# EasyEDA Pro project travellium-12v-desktop-power-supply-cc8d8467.epro, board EG1163S_C_PCB_1
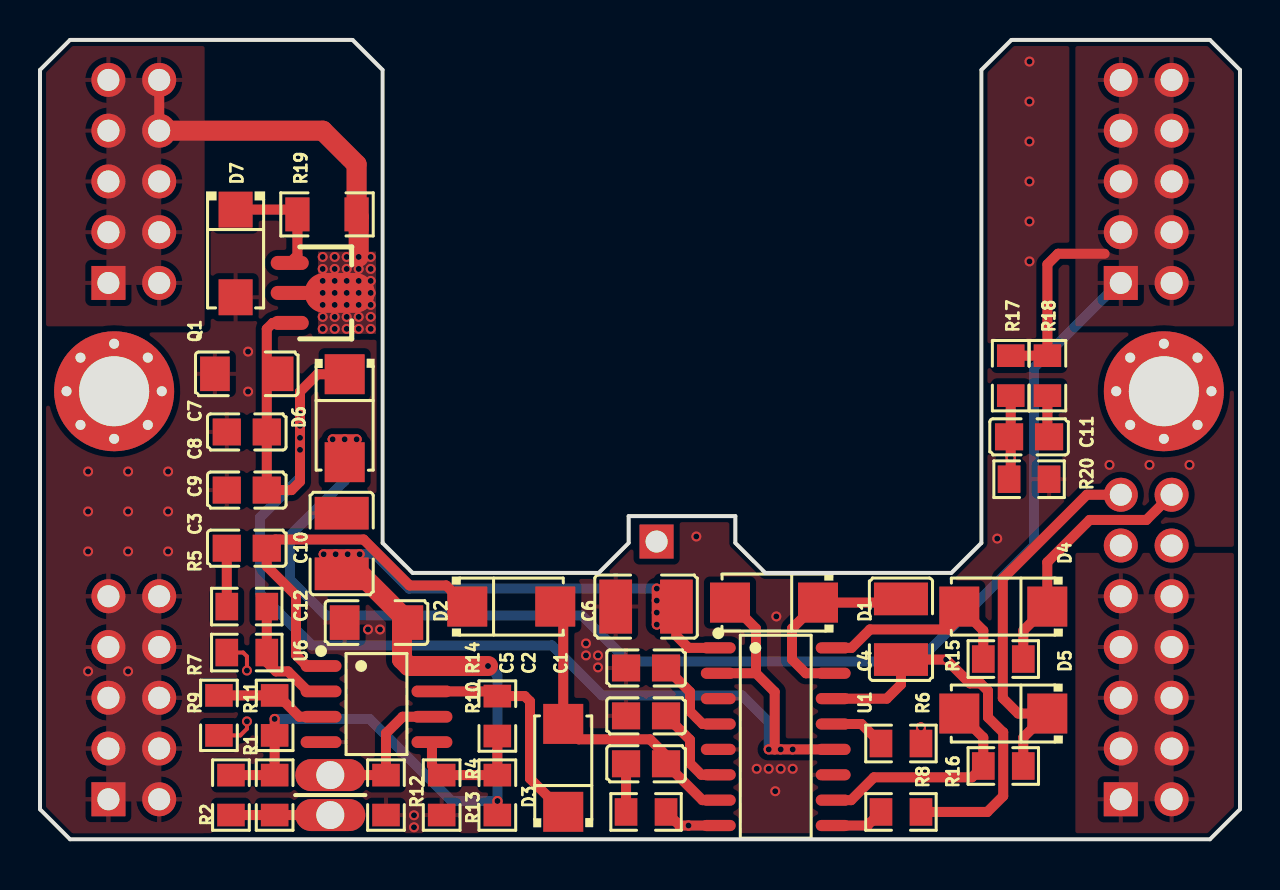
[diagram p15: board, top side]
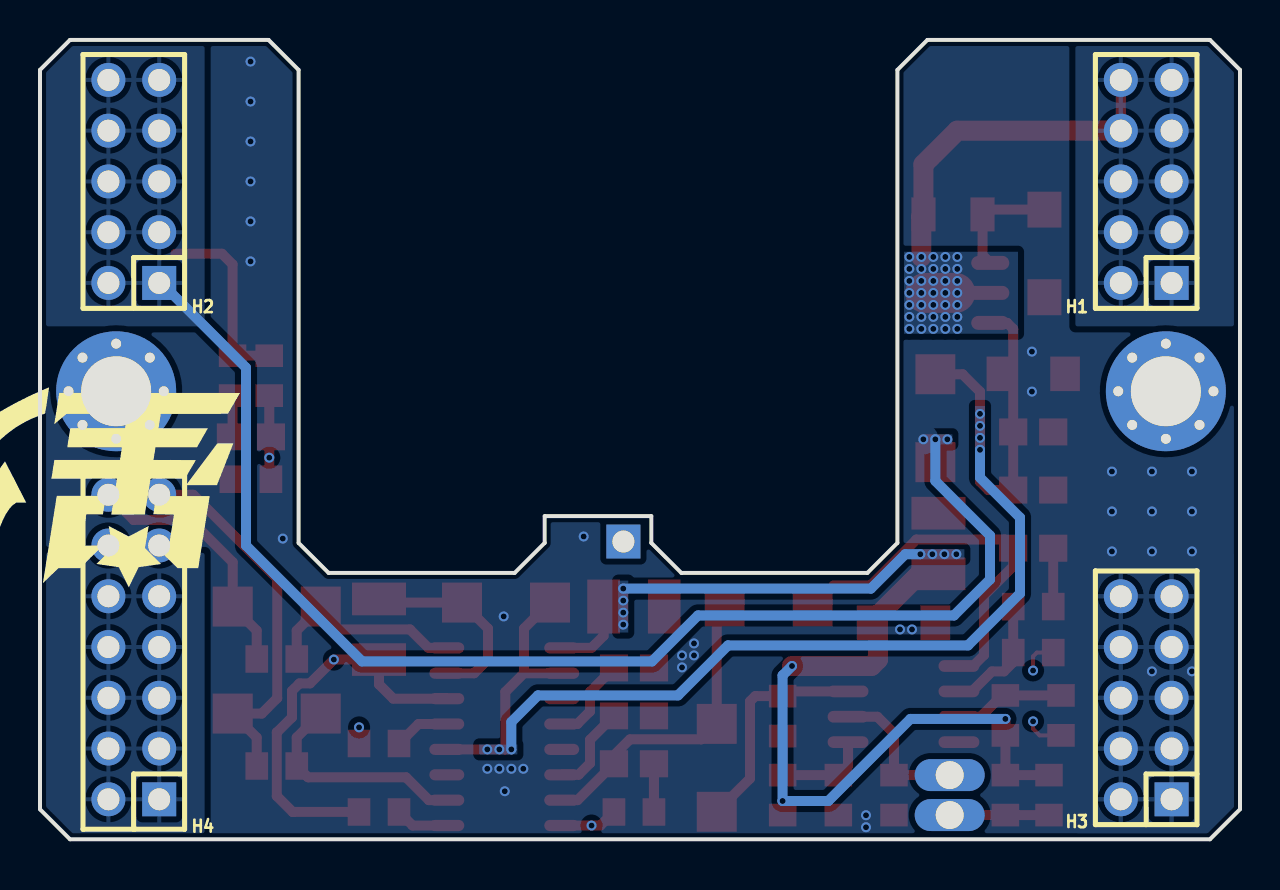
[diagram p16: board, bottom side, seen from below]

Outline 60 x 40 mm; copper layers: Top Layer, Inner1, Inner2, Bottom Layer. Coordinates in mm from the lower left corner of the outline.
Outline path: 0,38.5 0,1.5 1.5,0 58.5,0 60,1.5 60,38.5 58.5,40 48.57,40 47.07,38.5 47.07,14.83 45.57,13.33 36.27,13.33 34.77,14.83 34.77,16.17 29.43,16.17 29.43,14.83 27.93,13.33 18.63,13.33 17.13,14.83 17.13,38.5 15.63,40 1.5,40 0,38.5
Stack: Top Layer 0.035mm 外层铜厚1oz / Dielectric1 0.2104mm 7628 RC49% 8.6mil / Inner1 0.0152mm 内层铜厚 / Dielectric2 1.065mm 1.1mm H/HOZ Copper / Inner2 0.0152mm 内层铜厚 / Dielectric3 0.2104mm 7628 RC49% 8.6mil / Bottom Layer 0.035mm 外层铜厚1oz

## Design rules (mm)
net N: DP2
net P: DP2
spacing copperThickness1oz (default): track to track 0.102, other pairs 0.152 to 0.3
spacing copperThickness2oz: track to track 0.203, other pairs 0.152 to 0.3
spacing Plane_innerPlane: track to track 0.102, other pairs 0.152 to 0.3
spacing Copper_copperRegion: track to track 0.102, other pairs 0.152 to 0.3
track width copperThickness1oz: min 0.127, default 0.254, max 2.54
track width copperThickness2oz: min 0.203, default 0.254, max 2.54
track width Travellium (default): min 0.1, default 0.2, max 10
differential pair differentialPair (default): width min 0.127, default 0.254, max 2.54; gap min 0.152, default 0.152
pour e404 uses Copper_copperRegion
pour e446 uses Copper_copperRegion
pour e488 uses Copper_copperRegion
pour e530 uses Copper_copperRegion
pour e572 uses Copper_copperRegion
pour e614 uses Copper_copperRegion
pour e656 uses Copper_copperRegion
pour e698 uses Copper_copperRegion
pour e740 uses Copper_copperRegion
pour e782 uses Copper_copperRegion
pour e824 uses Copper_copperRegion
pour e866 uses Copper_copperRegion
pour e908 uses Copper_copperRegion
pour e950 uses Copper_copperRegion
pour e992 uses Copper_copperRegion
pour e1034 uses Copper_copperRegion
pour e1076 uses Copper_copperRegion
pour e1118 uses Copper_copperRegion
pour e1206 uses Copper_copperRegion
pour e1248 uses Copper_copperRegion
pour e1292 uses Copper_copperRegion

## Placement (name value [footprint] x y rotation side)
C1  100pF  [C0805]  30.3 8.57 180 top
C2  47pF  [C0805]  30.3 6.17 0 top
C3  10nF  [C0805]  10.34 14.57 180 top
C4  10uF  [C1210]  43.05 10.51 270 top
C5  10nF  [C0805]  30.3 3.78 180 top
C6  10uF  [C1210]  30.3 11.64 0 top
C7  100nF  [C1206]  10.34 23.29 0 top
C8  22uF  [C0805]  10.34 20.38 180 top
C9  22uF  [C0805]  10.34 17.47 180 top
C10  10uF  [C1210]  15.08 14.8 270 top
C11  10nF  [C0805]  49.45 20.14 0 top
C12  100nF  [C1206]  16.82 10.84 0 top
D1  SS34  [SMA_L4.3-W2.6-LS5.2-RD]  36.7 11.84 180 top
D2  SS34  [SMA_L4.3-W2.6-LS5.2-RD]  23.56 11.64 0 top
D3  SS34  [SMA_L4.3-W2.6-LS5.2-RD]  26.16 3.57 90 top
D4  SS34  [SMA_L4.3-W2.6-LS5.2-RD]  48.16 11.64 180 top
D5  SS34  [SMA_L4.3-W2.6-LS5.2-RD]  48.16 6.29 180 top
D6  SS34  [SMA_L4.3-W2.6-LS5.2-RD]  15.23 21.07 270 top
D7  1SMA4742A  [SMA_L4.4-W2.6-LS5.0-RD]  9.78 29.32 270 top
H1  PZ254-2-05-Z-8.5  [HDR-TH_10P-P2.54-V-M-R2-C5-S2.54]  4.69 32.92 90 bottom
H2  PZ254-2-05-Z-8.5  [HDR-TH_10P-P2.54-V-M-R2-C5-S2.54]  55.31 32.92 90 bottom
H3  PZ254-2-05-Z-8.5  [HDR-TH_10P-P2.54-V-M-R2-C5-S2.54]  4.69 7.08 90 bottom
H4  PZ254-2-07-Z-8.5  [HDR-TH_14P-P2.54-V-M-R2-C7-S2.54]  55.31 9.62 90 bottom
NOREF  -  [Pad_e113]  54.51 20.74 135 top
NOREF#2  -  [Pad_e115]  57.88 20.74 225 top
NOREF#3  -  [Pad_e107]  3.71 20.04 180 top
NOREF#4  -  [Pad_e111]  54.51 24.1 45 top
NOREF#5  -  [Pad_e119]  30.83 14.9 0 top
NOREF#6  -  [Pad_e116]  58.57 22.42 270 top
NOREF#7  -  [Pad_e114]  56.19 20.04 180 top
NOREF#8  -  [Pad_e108]  5.39 20.74 225 top
NOREF#9  -  [Pad_e106]  2.02 20.74 135 top
NOREF#10  -  [Pad_e102]  3.71 22.42 0 top
NOREF#11  -  [Pad_e117]  57.88 24.1 315 top
NOREF#12  -  [Pad_e101]  56.19 22.42 0 top
NOREF#13  -  [Pad_e120]  14.51 3.21 0 top
NOREF#14  -  [Pad_e112]  53.81 22.42 90 top
NOREF#15  -  [Pad_e105]  1.33 22.42 90 top
NOREF#16  -  [Pad_e118]  56.19 24.8 0 top
NOREF#17  -  [Pad_e104]  2.02 24.1 45 top
NOREF#18  -  [Pad_e109]  6.09 22.42 270 top
NOREF#19  -  [Pad_e121]  14.51 1.21 0 top
NOREF#20  -  [Pad_e103]  3.71 24.8 0 top
NOREF#21  -  [Pad_e110]  5.39 24.1 315 top
Q1  BCX56-16,115  [SOT-89-3_L4.5-W2.5-P1.50-LS4.1-TL-CW]  13.74 27.34 90 top
R1  120kΩ  [R0805]  11.73 2.21 90 top
R2  10kΩ  [R0805]  9.55 2.21 270 top
R4  10kΩ  [R0805]  22.87 2.21 270 top
R5  20kΩ  [R0805]  10.34 11.64 180 top
R6  100kΩ  [R0805]  43.05 4.79 0 top
R7  2kΩ  [R0805]  10.34 9.34 0 top
R8  100kΩ  [R0805]  43.05 1.37 0 top
R9  2kΩ  [R0805]  8.95 6.2 90 top
R10  470kΩ  [R0805]  22.87 6.17 90 top
R11  220kΩ  [R0805]  11.73 6.2 90 top
R12  10kΩ  [R0805]  17.3 2.21 90 top
R13  10kΩ  [R0805]  20.08 2.21 90 top
R14  20kΩ  [R0805]  30.3 1.37 180 top
R15  0Ω  [R0805]  48.16 9.02 0 top
R16  0Ω  [R0805]  48.16 3.67 0 top
R17  18kΩ  [R0805]  48.54 23.2 90 top
R18  2kΩ  [R0805]  50.37 23.2 90 top
R19  51kΩ  [R1206]  14.35 31.27 0 top
R20  2kΩ  [R0805]  49.45 18.02 180 top
U1  EG1163S  [SOP-16_L10.0-W3.9-P1.27-LS6.0-BL]  36.79 5.13 270 top
U6  GS8552-SR  [SOIC-8_L4.9-W3.9-P1.27-LS6.0-BL]  16.82 6.77 270 top

## Footprints (pads in the part's own frame, mm; a bottom-side part is the same pattern mirrored in y, then rotated)
C0805
  rect 1.41x1.35 smd: 1(-1,0) 2(1,0)
C1206
  rect 1.485x1.728 smd: 1(-1.593,0) 2(1.593,0)
C1210
  rect 1.635x2.7 smd: 1(-1.518,0) 2(1.518,0)
HDR-TH_10P-P2.54-V-M-R2-C5-S2.54
  rect 1.7x1.7 hole 1.1: 1(-5.08,-1.27)
  round 1.7 hole 1.1: 2(-5.08,1.27) 3(-2.54,-1.27) 4(-2.54,1.27) 5(0,-1.27) 6(0,1.27) 7(2.54,-1.27) 8(2.54,1.27) 9(5.08,-1.27) 10(5.08,1.27)
HDR-TH_14P-P2.54-V-M-R2-C7-S2.54
  rect 1.7x1.7 hole 1.1: 1(-7.62,-1.27)
  round 1.7 hole 1.1: 2(-7.62,1.27) 3(-5.08,-1.27) 4(-5.08,1.27) 5(-2.54,-1.27) 6(-2.54,1.27) 7(0,-1.27) 8(0,1.27) 9(2.54,-1.27) 10(2.54,1.27) 11(5.08,-1.27) 12(5.08,1.27) 13(7.62,-1.27) 14(7.62,1.27)
Pad_e101
  round 6 hole 3.5: 1(0,0)
Pad_e102
  round 6 hole 3.5: 1(0,0)
Pad_e103
  round 1 hole 0.5: 1(0,0)
Pad_e104
  round 1 hole 0.5: 1(0,0)
Pad_e105
  round 1 hole 0.5: 1(0,0)
Pad_e106
  round 1 hole 0.5: 1(0,0)
Pad_e107
  round 1 hole 0.5: 1(0,0)
Pad_e108
  round 1 hole 0.5: 1(0,0)
Pad_e109
  round 1 hole 0.5: 1(0,0)
Pad_e110
  round 1 hole 0.5: 1(0,0)
Pad_e111
  round 1 hole 0.5: 1(0,0)
Pad_e112
  round 1 hole 0.5: 1(0,0)
Pad_e113
  round 1 hole 0.5: 1(0,0)
Pad_e114
  round 1 hole 0.5: 1(0,0)
Pad_e115
  round 1 hole 0.5: 1(0,0)
Pad_e116
  round 1 hole 0.5: 1(0,0)
Pad_e117
  round 1 hole 0.5: 1(0,0)
Pad_e118
  round 1 hole 0.5: 1(0,0)
Pad_e119
  rect 1.7x1.7 hole 1.1: 1(0,0)
Pad_e120
  oval 3.5x1.6 hole 1.4: 1(0,0)
Pad_e121
  oval 3.5x1.6 hole 1.4: 2(0,0)
R0805
  rect 1.133x1.377 smd: 1(-1,0) 2(1,0)
R1206
  rect 1.208x1.701 smd: 1(-1.479,0) 2(1.479,0)
SMA_L4.3-W2.6-LS5.2-RD
  rect 2x2 smd: 1(-2.2,0) 2(2.2,0)
SMA_L4.4-W2.6-LS5.0-RD
  rect 1.8x1.7 smd: 1(-2.192,0) 2(2.192,0)
SOIC-8_L4.9-W3.9-P1.27-LS6.0-BL
  oval 0.588x2.045 smd: 1(-1.905,-2.772) 2(-0.635,-2.772) 3(0.635,-2.772) 4(1.905,-2.772) 5(1.905,2.772) 6(0.635,2.772) 7(-0.635,2.772) 8(-1.905,2.772)
SOP-16_L10.0-W3.9-P1.27-LS6.0-BL
  oval 0.56x1.745 smd: 1(-4.445,-2.873) 2(-3.175,-2.873) 3(-1.905,-2.873) 4(-0.635,-2.873) 5(0.635,-2.873) 6(1.905,-2.873) 7(3.175,-2.873) 8(4.445,-2.873) 9(4.445,2.873) 10(3.175,2.873) 11(1.905,2.873) 12(0.635,2.873) 13(-0.635,2.873) 14(-1.905,2.873) 15(-3.175,2.873) 16(-4.445,2.873)
SOT-89-3_L4.5-W2.5-P1.50-LS4.1-TL-CW
  oval 0.7x1.9 smd: 1(-1.501,1.25) 3(1.501,1.25)
  oval 0.7x2.1 smd: 2(0,1.151)
  oval 2x3.5 smd: 2(0,-1.25)

## Nets
As in the schematic, except:
VS: C4.2 NOREF#5.1 R8.2 U1.14
$1N6471: NOREF#13.1 R12.2 U6.6
$1N6497: NOREF#19.2 R1.1 R2.2

Pads without a net: NOREF 1; NOREF#2 1; NOREF#3 1; NOREF#4 1; NOREF#6 1; NOREF#7 1; NOREF#8 1; NOREF#9 1; NOREF#10 1; NOREF#11 1; NOREF#12 1; NOREF#14 1; NOREF#15 1; NOREF#16 1; NOREF#17 1; NOREF#18 1; NOREF#20 1; NOREF#21 1

## Via types
v1: diameter 0.5, hole 0.3, Top Layer to Bottom Layer, 100 vias

## Routing (per net, layer and track width the routed paths; a pad name or vN(x,y) marks a point on that pad's centre or on a via; arc(x,y) is an arc through that point)
GND:
  vias: v1(2.4,18.4) v1(2.4,16.4) v1(2.4,14.4) v1(2.4,8.4) v1(4.4,18.4) v1(4.4,16.4) v1(4.4,14.4) v1(4.4,8.4) v1(6.4,18.4) v1(6.4,16.4) v1(6.4,14.4) v1(10.4,24.4) v1(10.4,22.4) v1(16.4,10.5) v1(17,10.5) v1(18.7,1.2) v1(18.7,0.6) v1(27.3,9.8) v1(27.3,9.2) v1(27.9,9.2) v1(27.9,8.6) v1(32.82,15.15) v1(35.83,3.53) v1(36.43,3.53) v1(36.82,11.15) v1(36.76,2.4) v1(37.03,3.53) v1(37.63,3.53) v1(47.86,15.05) v1(49.47,38.92) v1(49.47,36.92) v1(49.47,34.92) v1(49.47,32.92) v1(49.47,30.92) v1(49.47,28.92) v1(53.47,18.73) v1(55.47,18.73) v1(57.47,18.73)
P5V: length 59.4
  Top Layer w0.5: v1(14.18,14.26) v1(14.78,14.26) v1(15.38,14.26) v1(15.98,14.26) ; v1(11.73,6.02) R11.1 R1.2 R2.1 ; R4.2 22.87,1.22 v1(22.87,1.92) ; U1.1 32.42,9.58 31.82,10.18 C6.2 ; v1(30.84,12.54) v1(30.84,11.94) v1(30.84,11.34) v1(30.84,10.74)
  Top Layer w1: 18.1,10.53 18.1,11.2 16.02,13.28 C10.2 ; 18.1,10.53 C12.2 ; 18.1,10.53 18.1,9 18.43,8.67 U6.8 v1(22.4,8.67)
  Bottom Layer w0.5: v1(30.84,12.54) 18.46,12.54 16.74,14.26 v1(15.98,14.26) ; v1(22.4,8.67) 22.87,8.2 v1(22.87,1.92) 20.58,1.92 16.48,6.02 v1(11.73,6.02)
P12V: length 75.1
  Top Layer w0.5: v1(15.83,20.01) v1(15.23,20.01) v1(14.63,20.01) ; R17.2 R18.2 50.37,28.77 50.9,29.3 53.23,29.3
  Bottom Layer w0.5: v1(15.23,20.01) 15.23,17.93 12.5,15.2 12.5,13 14.3,11.2 27.1,11.2 29.4,8.9 43.9,8.9 49.7,14.7 49.7,23.6 53.94,27.84 H2.1
P60V: length 79.8
  Top Layer w0.5: v1(44.05,5.6) R6.2 ; H1.10 H1.8
  Top Layer w1: v1(15.94,29.14) 15.94,31.17 R19.2 15.83,33.77 14.14,35.46 H1.8
  Inner2 w0.5: v1(44.05,5.6) 33.2,5.6 32.5,4.9 9.6,4.9 8.5,6 8.5,8.7 9.7,9.9 9.7,12.98 8.5,14.19 8.5,27.1 7.76,27.84 H1.2
  vias: v1(14.13,29.14) v1(14.13,28.54) v1(14.13,27.94) v1(14.13,27.34) v1(14.13,26.74) v1(14.13,26.14) v1(14.13,25.54) v1(14.74,29.14) v1(14.74,28.54) v1(14.74,27.94) v1(14.74,27.34) v1(14.74,26.74) v1(14.74,26.14) v1(14.74,25.54) v1(15.34,29.14) v1(15.34,28.54) v1(15.34,27.94) v1(15.34,27.34) v1(15.34,26.74) v1(15.34,26.14) v1(15.34,25.54) v1(15.94,28.54) v1(15.94,27.94) v1(15.94,27.34) v1(15.94,26.74) v1(15.94,26.14) v1(15.94,25.54) v1(16.53,29.14) v1(16.53,28.54) v1(16.53,27.94) v1(16.53,27.34) v1(16.53,26.74) v1(16.53,26.14) v1(16.53,25.54)
VCC: length 69.1
  Top Layer w0.5: 35.8,8.31 36.73,7.37 36.73,4.5 ; 35.8,8.31 U1.2 ; 35.8,8.31 35.8,10.54 D1.2 ; 36.73,4.5 v1(37.03,4.5) v1(37.63,4.5) U1.12 ; 36.73,4.5 v1(36.43,4.5) ; Q1.1 11.64,25.84 11.34,25.54 C8.1 C9.1 12.57,17.47 13,17.9 v1(13,19.49) v1(13,20.09) v1(13,20.69) v1(13,21.29) 13,22.4 13.87,23.27 D6.1
  Bottom Layer w0.5: v1(36.43,4.5) 36.43,5.87 35.1,7.2 28.1,7.2 25.6,9.7 13.6,9.7 11,12.3 11,16.1 13,18.1 v1(13,19.49)
CP: length 4.5
  Top Layer w0.5: C2.2 32.5,4.98 32.5,3.8 33.07,3.23 U1.6
ERRO: length 15.6
  Top Layer w0.5: U1.7 33.12,1.96 C5.1 31.3,4.2 30.5,5 26.94,5 D3.2 26.16,11.25 D2.2
FB: length 39.6
  Top Layer w0.5: R17.1 v1(48.54,19.09) 48.54,18.1 R20.2 ; R14.1 31.98,0.69 v1(32.42,0.69) U1.8
  Inner1 w0.2: v1(48.54,19.09) 48.54,4.14 45.09,0.69 v1(32.42,0.69)
HG: length 13
  Top Layer w0.5: R15.2 49.16,10.44 D4.1 50.36,13.86 52.48,15.98 55.32,15.98 H4.14
HO: length 10.9
  Top Layer w0.5: 46.26,11.34 D4.2 ; 46.26,11.34 46.56,11.64 ; 46.26,11.34 45.42,10.5 41.5,10.5 40.58,9.58 U1.16 ; 46.26,11.34 47.16,10.44 R15.1
LG: length 19.3
  Top Layer w0.5: R16.2 49.16,5.09 D5.1 48.91,6.29 48.14,7.06 48.14,13.04 52.34,17.24 H4.13
LO: length 11.3
  Top Layer w0.5: D5.2 47.16,5.09 R16.1 46.6,3.1 41.7,3.1 40.56,1.96 U1.10
N: length 53.2
  Top Layer w0.2: v1(10.35,5.9) 10.35,5.53 10.02,5.2 R9.1
  Inner2 w0.2: v1(10.35,5.9) 11.44,7 13.49,7 13.63,6.85 13.63,6.48 13.77,6.34 15.01,6.34 15.16,6.48 15.16,6.85 15.3,7 16.54,7 16.68,6.85 16.68,6.48 16.82,6.34 18.06,6.34 18.2,6.48 18.2,6.85 18.34,7 19.59,7 19.73,6.85 19.73,6.48 19.87,6.34 21.11,6.34 21.25,6.48 21.25,6.85 21.39,7 22.63,7 22.78,6.85 22.78,6.48 22.92,6.34 24.16,6.34 24.3,6.48 24.3,6.85 24.44,7 46.34,7 H4.11
OUT1: length 19
  Top Layer w0.5: D2.1 20.31,12.7 18.48,12.7 16.18,15 11.77,15 C3.1 11.34,13.66 12.8,12.2 12.8,9.22 13.35,8.67 U6.1
OUT2: length 11.3
  Top Layer w0.5: U6.7 22.63,7.4 R10.2 24.23,7.17 24.5,6.9 24.5,3.04 D3.1
P: length 53.2
  Top Layer w0.2: R7.1 10.16,9.34 10.35,9.15 v1(10.35,8.44)
  Inner2 w0.2: v1(10.35,8.44) 11.44,7.35 46.19,7.35 52.8,13.96 52.8,15.2 53.4,15.8 55.48,15.8 H4.12
SDHIN: length 2.8
  Top Layer w0.5: R6.1 41.07,5.77 U1.13
SDLIN: length 2.7
  Top Layer w0.5: R8.1 41.37,0.69 U1.9
SS: length 4.3
  Top Layer w0.5: U1.4 33.13,5.77 32.5,6.4 32.5,7.37 C1.1
VB: length 10
  Top Layer w0.5: 43.05,12.03 42.87,11.84 D1.1 37.6,10.54 37.6,9 38.29,8.31 U1.15
VS: length 38.7
  Top Layer w0.5: R8.2 47.37,1.37 48.16,2.16 48.16,5.35 48.15,5.35 47.4,6.1 47.4,7.42 47.03,7.8 46.5,7.8 v1(45.31,8.99) C4.2 43.05,7.75 42.34,7.04 U1.14
  Inner2 w0.5: v1(45.31,8.99) 33.71,8.99 32.7,10 32.7,13.03 NOREF#5.1
$1N6441: length 2.4
  Top Layer w0.5: R14.2 C5.2
$1N6469: length 6.1
  Top Layer w0.5: U6.2 13.4,7.4 12.4,8.4 11.8,8.4 11.34,8.86 R5.1
$1N6471: length 7.5
  Top Layer w0.5: NOREF#13.1 R12.2 17.3,5.3 18.13,6.13 U6.6
$1N6473: length 5.5
  Top Layer w0.5: R9.2 11.9,7.2 12.97,6.13 U6.3
$1N6474: length 6.6
  Top Layer w0.5: R10.1 R4.1 R13.2 19.6,3.7 U6.5
$1N6479: length 2.9
  Top Layer w0.5: R5.2 C3.2
$1N6497: length 5
  Top Layer w0.5: R2.2 R1.1 NOREF#19.2
$1N6504: length 5.8
  Top Layer w0.5: 12.49,28.84 12.87,29.23 12.87,31.27 12.63,31.51 9.78,31.51
$1N22064: length 2.1
  Top Layer w0.5: R18.1 50.37,20.22 C11.2

## Copper pours and planes (outline as drawn; the poured copper is in the pictures)
GND on Top Layer: 8.23,-0.57 -0.35,-0.57 -0.35,14.33 8.23,14.33
GND on Top Layer: 3.42,12.16 5.99,12.16 5.99,2 3.42,2
GND on Top Layer: 0,40 60,40 60,0 0,0
GND on Bottom Layer: 8.23,-0.57 -0.35,-0.57 -0.35,14.33 8.23,14.33
GND on Bottom Layer: -0.6,40.6 60.6,40.6 60.6,-0.6 -0.6,-0.6
GND on Inner1: -0.2,40.2 60.2,40.2 60.2,-0.2 -0.2,-0.2
GND on Inner1: 8.23,-0.57 -0.35,-0.57 -0.35,14.33 8.23,14.33
GND on Inner2: -0.4,40.4 60.4,40.4 60.4,-0.4 -0.4,-0.4
GND on Inner2: 8.23,-0.57 -0.35,-0.57 -0.35,14.33 8.23,14.33
P5V on Bottom Layer: 13.78,14.51 16.38,14.51 16.38,14.01 13.78,14.01
P5V on Bottom Layer: 30.59,12.94 31.09,12.94 31.09,10.34 30.59,10.34
P12V on Top Layer: 54.04,38 56.58,38 56.58,27.84 54.04,27.84
P12V on Top Layer: 51.77,40.57 60.35,40.57 60.35,25.67 51.77,25.67
P12V on Bottom Layer: 51.77,40.57 60.35,40.57 60.35,25.67 51.77,25.67
P12V on Inner1: 51.77,40.57 60.35,40.57 60.35,25.67 51.77,25.67
P12V on Inner2: 51.77,40.57 60.35,40.57 60.35,25.67 51.77,25.67
P60V on Top Layer: 3.42,38 5.96,38 5.96,27.84 3.42,27.84
P60V on Top Layer: -0.35,40.57 8.23,40.57 8.23,25.67 -0.35,25.67
P60V on Top Layer: 13.9,29.4 16.8,29.4 16.8,25.3 13.9,25.3
P60V on Top Layer: 13.9,29.4 16.8,29.4 16.8,25.3 13.9,25.3
P60V on Bottom Layer: -0.35,40.57 8.23,40.57 8.23,25.67 -0.35,25.67
P60V on Bottom Layer: 11.1,29.4 16.8,29.4 16.8,25.3 11.1,25.3
P60V on Inner1: -0.35,40.57 8.23,40.57 8.23,25.67 -0.35,25.67
P60V on Inner2: 11.1,29.4 16.8,29.4 16.8,25.3 11.1,25.3
P60V on Inner2: -0.35,40.57 8.23,40.57 8.23,25.67 -0.35,25.67
VCC on Bottom Layer: 12.75,21.69 13.25,21.69 13.25,19.09 12.75,19.09
IN on Top Layer: 60.35,-0.57 51.77,-0.57 51.77,14.33 60.35,14.33
IN on Top Layer: 54.04,12.16 56.58,12.16 56.58,2 54.04,2
IN on Bottom Layer: 60.35,-0.57 51.77,-0.57 51.77,14.33 60.35,14.33
IN on Inner1: 60.35,-0.57 51.77,-0.57 51.77,14.33 60.35,14.33
IN on Inner1: 60.35,-0.57 51.77,-0.57 51.77,14.33 60.35,14.33
IN on Inner2: 60.35,-0.57 51.77,-0.57 51.77,14.33 60.35,14.33

Small or netless copper shapes (teardrops, artwork), in the pictures only: 2 on Bottom Layer
